# Altium schematic sheet ETHERNET_INTERFACE.SchDoc
size A4; SheetNumber: 5; SheetTotal: 20
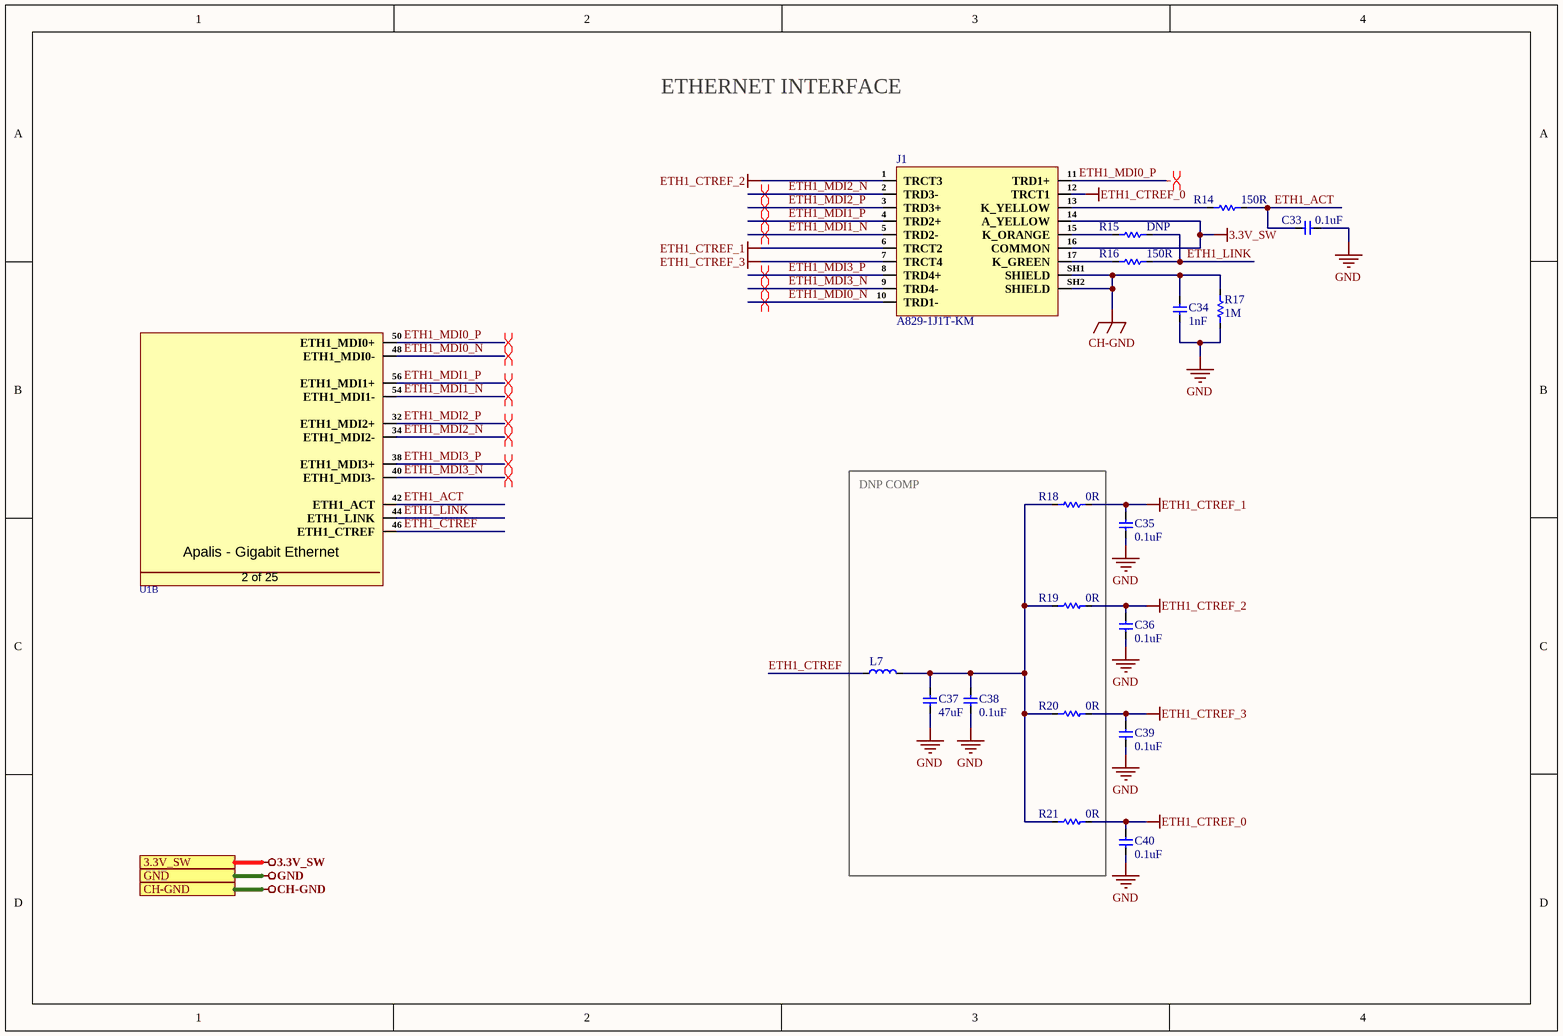
[diagram p0: ETHERNET_INTERFACE.SchDoc]

## Parts
C33  0.1uF  [Cap-0402]
C34  1nF  [Cap-1206]
C35  0.1uF  [Cap-0402]
C36  0.1uF  [Cap-0402]
C37  47uF  [Cap 2220]
C38  0.1uF  [Cap-0402]
C39  0.1uF  [Cap-0402]
C40  0.1uF  [Cap-0402]
J1  A829-1J1T-KM  [A829-1J1T-KM]
L7  BLM18EG221TN1D  [IND-0603 (1608 Metric)]  (value not drawn)
R14  150R  [Res-0402]
R15  DNP  [Res-0402]
R16  150R  [Res-0402]
R17  1M  [Res-0402]
R18  0R  [Res-0402]
R19  0R  [Res-0402]
R20  0R  [Res-0402]
R21  0R  [Res-0402]
U1  MM70-314B1-2-R300  [MM70-314B1-2-R300]  (value not drawn)  (part B of 25)

## Blocks framed on the sheet
DNP COMP: C37 C38 L7 R18-R21

## Ports
3.3V_SW (see Top_Sheet[1B], DIGITAL_I-O_O-P[1D], FUTURE_USE_CONNECTOR[1D], HDMI_INTERFACE[1D], I2C_INTERFACE[1B], MICRO_SD_CARD_INTERFACE[1D], UART_INTERFACE[1D]), CH-GND (see Top_Sheet[1B], HDMI_INTERFACE[1D], LTE_MODULE[1D], MECHANICAL_FOR_PCB[1D], USB3.0_INTERFACE[1D]), GND (see Top_Sheet[1B], 03-CAN2_SPI_CAN_CONTROLLER[1D], APALIS_POWER_SUPPLY[1D], CAN2_SPI_CAN_CONTROLLER[1D], CODEC_INTERFACE[1D], CONNECTORS[1D], DC_DC_CONVERTER[1D], DIGITAL_I-O_O-P[1D], FUTURE_USE_CONNECTOR[1D], GPIO_NC_INTERFACE[4B], HDMI_INTERFACE[1D], I2C_INTERFACE[1B], INPUT_SUPPLY_PROTECTION[1D], LTE_MODULE[1D], MECHANICAL_FOR_PCB[1D], MICRO_SD_CARD_INTERFACE[1D], Reset_and_SDIO[1D], UART_INTERFACE[1D], USB3.0_INTERFACE[1D])

## Nets
3.3V_SW: J1.14(A_YELLOW) J1.16(COMMON) ; port 3.3V_SW
CH-GND: C34.2 J1.SH1(SHIELD) J1.SH2(SHIELD) R17.2 ; port CH-GND
ETH1_CTREF_0: C40.2 J1.12(TRCT1) R21.2
ETH1_CTREF_1: C35.2 J1.6(TRCT2) R18.2
ETH1_CTREF_2: C36.2 J1.1(TRCT3) R19.2
ETH1_CTREF_3: C39.2 J1.7(TRCT4) R20.2
GND: C33.2 C34.1 C35.1 C36.1 C37.1 C38.1 C39.1 C40.1 R17.1 ; port GND
ETH1_ACT: C33.1 R14.2 U1.42(ETH1_ACT)
ETH1_CTREF: L7.1 U1.46(ETH1_CTREF)
ETH1_LINK: R15.2 R16.2 U1.44(ETH1_LINK)
ETH1_MDI0_N: J1.10(TRD1-) U1.48(ETH1_MDI0-)
ETH1_MDI0_P: J1.11(TRD1+) U1.50(ETH1_MDI0+)
ETH1_MDI1_N: J1.5(TRD2-) U1.54(ETH1_MDI1-)
ETH1_MDI1_P: J1.4(TRD2+) U1.56(ETH1_MDI1+)
ETH1_MDI2_N: J1.2(TRD3-) U1.34(ETH1_MDI2-)
ETH1_MDI2_P: J1.3(TRD3+) U1.32(ETH1_MDI2+)
ETH1_MDI3_N: J1.9(TRD4-) U1.40(ETH1_MDI3-)
ETH1_MDI3_P: J1.8(TRD4+) U1.38(ETH1_MDI3+)
NetC37_2: C37.2 C38.2 L7.2 R18.1 R19.1 R20.1 R21.1
NetJ1_13: J1.13(K_YELLOW) R14.1
NetJ1_15: J1.15(K_ORANGE) R15.1
NetJ1_17: J1.17(K_GREEN) R16.1

## Layout directives
differential pair; differential pair class DIFF-ETH-100; rule Impedance Constraint [Min = 98.00    Max = 103.0    ]; rule Matched Net Lengths [Tolerance = 0.508mm]: ETH1_MDI0_N, ETH1_MDI0_P, ETH1_MDI1_N, ETH1_MDI1_P, ETH1_MDI2_N, ETH1_MDI2_P, ETH1_MDI3_N, ETH1_MDI3_P

## Notes on the sheet
- ETHERNET INTERFACE
- (in symbol MM70-314B1-2-R300, part B) Apalis - Gigabit Ethernet; 2 of 25

## Library data of the parts
C33 C35 C36 C38-C40 = C0402C104K4REC7867: Cap Cer 0402 0.1UF 16V X7R 10%; Manufacturer: KEMET; Item Type: Capacitor; Supplier: Digi-Key; Supplier Part Number: 399-C0402C104K4REC7867CT-ND; Manufacturer Part Number: C0402C104K4REC7867; RoHS: No; Category: Ceramic Capacitors; Stock: 10918; Pricing: 1=0.1, 10=0.072, 50=0.0408, 100=0.0338, 500=0.02372, 1000=0.01963, 2500=0.01827, 5000=0.01672 (USD)
C34 = C1206C102KGRACAUTO: CAP CER 1000PF 2KV X7R 1206; Manufacturer: KEMET; Dielectric Material: Ceramic; Tolerance: 10%; Supplier: Mouser; Supplier Part Number: 80-C1206C102KGRAUTO; Manufacturer Part Number: C1206C102KGRACAUTO; RoHS: No; Category: Ceramic Capacitors; Stock: 90441; Pricing: 1=0.26, 10=0.119, 50=0.119, 100=0.072, 1000=0.063, 10000=0.052 (USD); Mounting Technology: Surface Mount; Case/Package: 1206; Case Code (Metric): 3216; Case Code (Imperial): 1206; Contact Plating: Tin,Matte; Min Operating Temperature: -55°C; Max Operating Temperature: 125°C; Voltage Rating: 2kV; Packaging: Cut Tape; Value: 1nF; Dielectric: X7R; Termination: SMD/SMT; Voltage Rating (DC): 2kV; Series: SMD Auto X7R HV; Construction: Flat; Length: 3.2mm; Ratings: AEC-Q200; Reach SVHC Compliant: No; RoHS Compliant: No; ComponentLink1URL: http://www.farnell.com/datasheets/2741171.pdf?src-supplier=Farnell; ComponentLink1Description: http://www.farnell.com/datasheets/2741171.pdf?src-supplier=Farnell; ComponentLink2URL: http://www.mouser.com/ds/2/212/KEM_C1010_X7R_HV_SMD-1102742.pdf?src-supplier=Mouser; ComponentLink2Description: http://www.mouser.com/ds/2/212/KEM_C1010_X7R_HV_SMD-1102742.pdf?src-supplier=Mouser; ComponentLink3URL: http://capacitoredge.kemet.com/capedge2/DataSheet/Datasheet-C1206C102KGRACAUTO.pdf?pn=C1206C102KGRACAUTO&src-supplier=Avnet; ComponentLink3Description: http://capacitoredge.kemet.com/capedge2/DataSheet/Datasheet-C1206C102KGRACAUTO.pdf?pn=C1206C102KGRACAUTO&src-supplier=Avnet; ComponentLink4URL: http://www.farnell.com/datasheets/2741171.pdf?src-supplier=Newark; ComponentLink4Description: http://www.farnell.com/datasheets/2741171.pdf?src-supplier=Newark; ComponentLink5URL: https://datasheet.octopart.com/C1206C102KGRACAUTO-Kemet-datasheet-41767101.pdf?src-supplier=Newark; ComponentLink5Description: https://datasheet.octopart.com/C1206C102KGRACAUTO-Kemet-datasheet-41767101.pdf?src-supplier=Newark; ComponentLink6URL: https://api.kemet.com/component-edge/download/datasheet/C1206C102KGRACAUTO.pdf?src-supplier=Digi-Key; ComponentLink6Description: https://api.kemet.com/component-edge/download/datasheet/C1206C102KGRACAUTO.pdf?src-supplier=Digi-Key; ComponentLink7URL: https://datasheet.octopart.com/C1206C102KGRACAUTO-KEMET-datasheet-149525142.pdf?src-supplier=Farnell; ComponentLink7Description: https://datasheet.octopart.com/C1206C102KGRACAUTO-KEMET-datasheet-149525142.pdf?src-supplier=Farnell; ComponentLink8URL: http://www.farnell.com/datasheets/2741171.pdf?src-supplier=Element14; ComponentLink8Description: http://www.farnell.com/datasheets/2741171.pdf?src-supplier=Element14; ComponentLink9URL: https://datasheet.octopart.com/C1206C102KGRACAUTO-Kemet-datasheet-66532414.pdf?src-supplier=Element14; ComponentLink9Description: https://datasheet.octopart.com/C1206C102KGRACAUTO-Kemet-datasheet-66532414.pdf?src-supplier=Element14; ComponentLink10URL: https://datasheet.octopart.com/C1206C102KGRACAUTO-KEMET-datasheet-140424778.pdf?src-supplier=TME; ComponentLink10Description: https://datasheet.octopart.com/C1206C102KGRACAUTO-KEMET-datasheet-140424778.pdf?src-supplier=TME; ComponentLink11URL: https://datasheet.octopart.com/C1206C102KGRACAUTO-KEMET-datasheet-147336163.pdf?src-supplier=LKR; ComponentLink11Description: https://datasheet.octopart.com/C1206C102KGRACAUTO-KEMET-datasheet-147336163.pdf?src-supplier=LKR
C37 = CGA9N3X7R1E476M230KB: CAP CER 47UF 25V X7R 2220; Manufacturer: TDK; Material: 4241ConductorMaterial; Tolerance: 20%; Supplier: Rs; Supplier Part Number: 2427522; Manufacturer Part Number: CGA9N3X7R1E476M230KB; RoHS: Yes; Category: Ceramic Capacitors; Stock: 467; Pricing: 1=3.07, 5=2.92, 10=2.76, 20=2.46, 100=2 (GBP); Mounting Technology: Surface Mount; Case/Package: 2220; Case Code (Imperial): 2220; Case Code (Metric): 5750; Min Operating Temperature: -55°C; Max Operating Temperature: 125°C; Packaging: Cut Tape; Value: 47uF; Voltage Rating: 25V; Series: CGA; Length: 5.7mm; Width: 5mm; Height: 2.8mm; Ratings: AEC-Q200; RoHS Compliant: Yes; ComponentLink1URL: https://product.tdk.com/info/en/catalog/spec/mlccspec_automotive_general_midvoltage_en.pdf?src-supplier=Digi-Key; ComponentLink1Description: https://product.tdk.com/info/en/catalog/spec/mlccspec_automotive_general_midvoltage_en.pdf?src-supplier=Digi-Key; ComponentLink2URL: https://product.tdk.com/info/en/catalog/datasheets/mlcc_automotive_general_en.pdf?src-supplier=Digi-Key; ComponentLink2Description: https://product.tdk.com/info/en/catalog/datasheets/mlcc_automotive_general_en.pdf?src-supplier=Digi-Key; ComponentLink3URL: https://product.tdk.com/info/en/catalog/datasheets/mlcc_automotive_general_en.pdf?ref_disty=digikey&src-supplier=Digi-Key; ComponentLink3Description: https://product.tdk.com/info/en/catalog/datasheets/mlcc_automotive_general_en.pdf?ref_disty=digikey&src-supplier=Digi-Key; ComponentLink4URL: https://datasheet.octopart.com/CGA9N3X7R1E476M230KB-TDK-datasheet-43366117.pdf?src-supplier=Future+Electronics; ComponentLink4Description: https://datasheet.octopart.com/CGA9N3X7R1E476M230KB-TDK-datasheet-43366117.pdf?src-supplier=Future+Electronics
J1 = A829-1J1T-KM: CONN JACK 1PORT 1000 BASE-TX PCB; Manufacturer: Bel; Supplier: Mouser; Supplier Part Number: 530-A829-1J1T-KM; Manufacturer Part Number: A829-1J1T-KM; RoHS: Yes; Category: Modular / Ethernet Connectors; Stock: 1152; Pricing: 1=7.48, 10=6.77, 50=6.4, 100=6.4, 1000=4.99, 10000=4.99 (USD); ComponentLink1URL: https://belfuse.com/resources/drawings/magneticsolutions/dr-mag-a829-1j1t-km.pdf?src-supplier=Digi-Key; ComponentLink1Description: https://belfuse.com/resources/drawings/magneticsolutions/dr-mag-a829-1j1t-km.pdf?src-supplier=Digi-Key; ComponentLink2URL: https://datasheet.octopart.com/A829-1J1T-KM-Bel-Fuse-datasheet-154547170.pdf?src-supplier=Electro+Sonic; ComponentLink2Description: https://datasheet.octopart.com/A829-1J1T-KM-Bel-Fuse-datasheet-154547170.pdf?src-supplier=Electro+Sonic
L7 = BLM18EG221TN1D: FERRITE BEAD 220 OHM 0603 1LN; Manufacturer: Murata; Supplier: Avnet; Supplier Part Number: BLM18EG221TN1D; Manufacturer Part Number: BLM18EG221TN1D; RoHS: Yes; Category: Ferrite Beads and Chips; Stock: 4000; Pricing: 4000=0.07735, 8000=0.07553, 16000=0.07371, 24000=0.07189, 32000=0.07007 (USD); ComponentLink1URL: https://datasheet.ciiva.com/11795/0900766b811b5866-11795384.pdf?src-supplier=Rs; ComponentLink1Description: https://datasheet.ciiva.com/11795/0900766b811b5866-11795384.pdf?src-supplier=Rs; ComponentLink2URL: https://datasheet.ciiva.com/41449/001172266-da-01-en-drossel-0603-220r-1-6x0-8mm-4000st-41449580.pdf?src-supplier=Conrad; ComponentLink2Description: https://datasheet.ciiva.com/41449/001172266-da-01-en-drossel-0603-220r-1-6x0-8mm-4000st-41449580.pdf?src-supplier=Conrad; ComponentLink3URL: https://datasheet.ciiva.com/1467/5169-1467159.pdf?src-supplier=Element14; ComponentLink3Description: https://datasheet.ciiva.com/1467/5169-1467159.pdf?src-supplier=Element14; ComponentLink4URL: https://datasheet.ciiva.com/1467/5169-1467160.pdf?src-supplier=Element14; ComponentLink4Description: https://datasheet.ciiva.com/1467/5169-1467160.pdf?src-supplier=Element14; ComponentLink5URL: https://datasheet.ciiva.com/8510/l0110s0101blm18e-8510167.pdf?src-supplier=Avnet; ComponentLink5Description: https://datasheet.ciiva.com/8510/l0110s0101blm18e-8510167.pdf?src-supplier=Avnet; ComponentLink6URL: https://datasheet.ciiva.com/16419/l0110s0101blm18e-16419150.pdf?src-supplier=Future+Electronics; ComponentLink6Description: https://datasheet.ciiva.com/16419/l0110s0101blm18e-16419150.pdf?src-supplier=Future+Electronics; ComponentLink7URL: https://datasheet.ciiva.com/6211/l0110s0101blm18e-6211853.pdf?src-supplier=Digi-Key; ComponentLink7Description: https://datasheet.ciiva.com/6211/l0110s0101blm18e-6211853.pdf?src-supplier=Digi-Key
R14-R16 = CRGCQ0402F150R: RES 150 OHM 1% 1/16W 0402; Manufacturer: TE Connectivity; Supplier: Arrow Electronics; Supplier Part Number: CRGCQ0402F150R; Manufacturer Part Number: CRGCQ0402F150R; RoHS: Yes; Category: Chip SMD Resistors; Stock: 712; Pricing: 1=0.0975, 10=0.0101, 25=0.01, 100=0.0051, 250=0.005, 500=0.0042 (USD); ComponentLink1URL: http://datasheet.octopart.com/CRGCQ0402F150R-TE-Connectivity-datasheet-114679081.pdf?src-supplier=Verical; ComponentLink1Description: http://datasheet.octopart.com/CRGCQ0402F150R-TE-Connectivity-datasheet-114679081.pdf?src-supplier=Verical; ComponentLink2URL: http://datasheet.octopart.com/CRGCQ0402F150R-TE-Connectivity-datasheet-114679081.pdf?src-supplier=Avnet; ComponentLink2Description: http://datasheet.octopart.com/CRGCQ0402F150R-TE-Connectivity-datasheet-114679081.pdf?src-supplier=Avnet; ComponentLink3URL: http://datasheet.octopart.com/CRGCQ0402F150R-TE-Connectivity-datasheet-114679081.pdf?src-supplier=Newark; ComponentLink3Description: http://datasheet.octopart.com/CRGCQ0402F150R-TE-Connectivity-datasheet-114679081.pdf?src-supplier=Newark; ComponentLink4URL: https://4donline.ihs.com/images/VipMasterIC/IC/TYEL/TYEL-S-A0004929575/TYEL-S-A0004929575-1.pdf?hkey=52A5661711E402568146F3353EA87419&src-supplier=Newark; ComponentLink4Description: https://4donline.ihs.com/images/VipMasterIC/IC/TYEL/TYEL-S-A0004929575/TYEL-S-A0004929575-1.pdf?hkey=52A5661711E402568146F3353EA87419&src-supplier=Newark; ComponentLink5URL: http://datasheet.octopart.com/CRGCQ0402F150R-TE-Connectivity-datasheet-114679081.pdf?src-supplier=Onlinecomponents.com; ComponentLink5Description: http://datasheet.octopart.com/CRGCQ0402F150R-TE-Connectivity-datasheet-114679081.pdf?src-supplier=Onlinecomponents.com; ComponentLink6URL: https://4donline.ihs.com/images/VipMasterIC/IC/TYEL/TYEL-S-A0004929575/TYEL-S-A0004929575-1.pdf?hkey=52A5661711E402568146F3353EA87419&src-supplier=Farnell; ComponentLink6Description: https://4donline.ihs.com/images/VipMasterIC/IC/TYEL/TYEL-S-A0004929575/TYEL-S-A0004929575-1.pdf?hkey=52A5661711E402568146F3353EA87419&src-supplier=Farnell; ComponentLink7URL: http://datasheet.octopart.com/CRGCQ0402F150R-TE-Connectivity-datasheet-114679081.pdf?src-supplier=Mouser; ComponentLink7Description: http://datasheet.octopart.com/CRGCQ0402F150R-TE-Connectivity-datasheet-114679081.pdf?src-supplier=Mouser; ComponentLink8URL: https://www.te.com/commerce/DocumentDelivery/DDEController?Action=srchrtrv&DocNm=1773204-3&DocType=DS&DocLang=English&src-supplier=Digi-Key; ComponentLink8Description: https://www.te.com/commerce/DocumentDelivery/DDEController?Action=srchrtrv&DocNm=1773204-3&DocType=DS&DocLang=English&src-supplier=Digi-Key; ComponentLink9URL: http://datasheet.octopart.com/CRGCQ0402F150R-TE-Connectivity-datasheet-114679081.pdf?src-supplier=Digi-Key; ComponentLink9Description: http://datasheet.octopart.com/CRGCQ0402F150R-TE-Connectivity-datasheet-114679081.pdf?src-supplier=Digi-Key; ComponentLink10URL: http://datasheet.octopart.com/CRGCQ0402F150R-TE-Connectivity-datasheet-114679081.pdf?src-supplier=Heilind+Electronics; ComponentLink10Description: http://datasheet.octopart.com/CRGCQ0402F150R-TE-Connectivity-datasheet-114679081.pdf?src-supplier=Heilind+Electronics; ComponentLink11URL: http://datasheet.octopart.com/CRGCQ0402F150R-TE-Connectivity-datasheet-114679081.pdf?src-supplier=Electro+Sonic; ComponentLink11Description: http://datasheet.octopart.com/CRGCQ0402F150R-TE-Connectivity-datasheet-114679081.pdf?src-supplier=Electro+Sonic; ComponentLink12URL: http://datasheet.octopart.com/CRGCQ0402F150R-TE-Connectivity-datasheet-114679081.pdf?src-supplier=Interstate+Connecting+Components; ComponentLink12Description: http://datasheet.octopart.com/CRGCQ0402F150R-TE-Connectivity-datasheet-114679081.pdf?src-supplier=Interstate+Connecting+Components; ComponentLink13URL: http://datasheet.octopart.com/CRGCQ0402F150R-TE-Connectivity-datasheet-114679081.pdf?src-supplier=TME; ComponentLink13Description: http://datasheet.octopart.com/CRGCQ0402F150R-TE-Connectivity-datasheet-114679081.pdf?src-supplier=TME; ComponentLink14URL: http://datasheet.octopart.com/CRGCQ0402F150R-TE-Connectivity-datasheet-114679081.pdf?src-supplier=Sager+Electronics; ComponentLink14Description: http://datasheet.octopart.com/CRGCQ0402F150R-TE-Connectivity-datasheet-114679081.pdf?src-supplier=Sager+Electronics; ComponentLink15URL: https://datasheet.octopart.com/CRGCQ0402F150R-TE-Connectivity-datasheet-114679081.pdf?src-supplier=Master+Electronics; ComponentLink15Description: https://datasheet.octopart.com/CRGCQ0402F150R-TE-Connectivity-datasheet-114679081.pdf?src-supplier=Master+Electronics
R17 = CRGCQ0402J1M0: RES 1M OHM 5% 1/16W 0402; Manufacturer: TE Connectivity; Value: 1MR; Max Power Dissipation: 63mW; Temperature Coefficient: 100ppm/°C; Power Rating: 62.5mW; Voltage Rating: 50V; Supplier: Arrow Electronics; Supplier Part Number: CRGCQ0402J1M0; Manufacturer Part Number: CRGCQ0402J1M0; RoHS: Yes; Category: Chip SMD Resistors; Stock: 50000; Pricing: 20000=0.0015 (USD); Case/Package: 0402; Case Code (Imperial): 0402; Case Code (Metric): 1005; Min Operating Temperature: -55°C; Max Operating Temperature: 155°C; Features: Moisture Resistant,Automotive AEC-Q200; Packaging: Cut Tape; Tolerance: 5%; Number of Terminations: 2; Series: CRGCQ; Voltage Rating (DC): 50V; Height: 400um; Ratings: AEC-Q200; RoHS Compliant: Yes; ComponentLink1URL: http://datasheet.octopart.com/CRGCQ0402J1M0-TE-Connectivity-datasheet-114679081.pdf?src-supplier=Mouser; ComponentLink1Description: http://datasheet.octopart.com/CRGCQ0402J1M0-TE-Connectivity-datasheet-114679081.pdf?src-supplier=Mouser; ComponentLink2URL: http://datasheet.octopart.com/CRGCQ0402J1M0-TE-Connectivity-datasheet-114679081.pdf?src-supplier=Arrow+Electronics; ComponentLink2Description: http://datasheet.octopart.com/CRGCQ0402J1M0-TE-Connectivity-datasheet-114679081.pdf?src-supplier=Arrow+Electronics; ComponentLink3URL: http://datasheet.octopart.com/CRGCQ0402J1M0-TE-Connectivity-datasheet-114679081.pdf?src-supplier=Onlinecomponents.com; ComponentLink3Description: http://datasheet.octopart.com/CRGCQ0402J1M0-TE-Connectivity-datasheet-114679081.pdf?src-supplier=Onlinecomponents.com; ComponentLink4URL: http://datasheet.octopart.com/CRGCQ0402J1M0-TE-Connectivity-datasheet-114679081.pdf?src-supplier=Digi-Key; ComponentLink4Description: http://datasheet.octopart.com/CRGCQ0402J1M0-TE-Connectivity-datasheet-114679081.pdf?src-supplier=Digi-Key; ComponentLink5URL: http://datasheet.octopart.com/CRGCQ0402J1M0-TE-Connectivity-datasheet-114679081.pdf?src-supplier=Verical; ComponentLink5Description: http://datasheet.octopart.com/CRGCQ0402J1M0-TE-Connectivity-datasheet-114679081.pdf?src-supplier=Verical; ComponentLink6URL: https://www.te.com/commerce/DocumentDelivery/DDEController?Action=srchrtrv&DocNm=1773204-3&DocType=DS&DocLang=English&src-supplier=Digi-Key; ComponentLink6Description: https://www.te.com/commerce/DocumentDelivery/DDEController?Action=srchrtrv&DocNm=1773204-3&DocType=DS&DocLang=English&src-supplier=Digi-Key; ComponentLink7URL: http://datasheet.octopart.com/CRGCQ0402J1M0-TE-Connectivity-datasheet-114679081.pdf?src-supplier=Newark; ComponentLink7Description: http://datasheet.octopart.com/CRGCQ0402J1M0-TE-Connectivity-datasheet-114679081.pdf?src-supplier=Newark; ComponentLink8URL: http://datasheet.octopart.com/CRGCQ0402J1M0-TE-Connectivity-datasheet-114679081.pdf?src-supplier=Avnet; ComponentLink8Description: http://datasheet.octopart.com/CRGCQ0402J1M0-TE-Connectivity-datasheet-114679081.pdf?src-supplier=Avnet; ComponentLink9URL: http://datasheet.octopart.com/CRGCQ0402J1M0-TE-Connectivity-datasheet-114679081.pdf?src-supplier=Farnell; ComponentLink9Description: http://datasheet.octopart.com/CRGCQ0402J1M0-TE-Connectivity-datasheet-114679081.pdf?src-supplier=Farnell; ComponentLink10URL: http://datasheet.octopart.com/CRGCQ0402J1M0-TE-Connectivity-datasheet-114679081.pdf?src-supplier=Sager+Electronics; ComponentLink10Description: http://datasheet.octopart.com/CRGCQ0402J1M0-TE-Connectivity-datasheet-114679081.pdf?src-supplier=Sager+Electronics; ComponentLink11URL: http://datasheet.octopart.com/CRGCQ0402J1M0-TE-Connectivity-datasheet-114679081.pdf?src-supplier=TME; ComponentLink11Description: http://datasheet.octopart.com/CRGCQ0402J1M0-TE-Connectivity-datasheet-114679081.pdf?src-supplier=TME; ComponentLink12URL: http://datasheet.octopart.com/CRGCQ0402J1M0-TE-Connectivity-datasheet-114679081.pdf?src-supplier=Electro+Sonic; ComponentLink12Description: http://datasheet.octopart.com/CRGCQ0402J1M0-TE-Connectivity-datasheet-114679081.pdf?src-supplier=Electro+Sonic; ComponentLink13URL: http://datasheet.octopart.com/CRGCQ0402J1M0-TE-Connectivity-datasheet-114679081.pdf?src-supplier=Interstate+Connecting+Components; ComponentLink13Description: http://datasheet.octopart.com/CRGCQ0402J1M0-TE-Connectivity-datasheet-114679081.pdf?src-supplier=Interstate+Connecting+Components; ComponentLink14URL: http://datasheet.octopart.com/CRGCQ0402J1M0-TE-Connectivity-datasheet-114679081.pdf?src-supplier=Heilind+Electronics; ComponentLink14Description: http://datasheet.octopart.com/CRGCQ0402J1M0-TE-Connectivity-datasheet-114679081.pdf?src-supplier=Heilind+Electronics; ComponentLink15URL: https://datasheet.octopart.com/CRGCQ0402J1M0-TE-Connectivity-datasheet-114679081.pdf?src-supplier=Master+Electronics; ComponentLink15Description: https://datasheet.octopart.com/CRGCQ0402J1M0-TE-Connectivity-datasheet-114679081.pdf?src-supplier=Master+Electronics
R18-R21 = ERJ-2GE0R00X: RES SMD 0 OHM JUMPER 1/10W 0402; Manufacturer: Panasonic; Value: 0mR; Power Rating: 100mW; Voltage Rating: 50V; Tolerance: 5%; Temperature Coefficient: 600ppm/°C; Supplier: Mouser; Supplier Part Number: 667-ERJ-2GE0R00X; Manufacturer Part Number: ERJ-2GE0R00X; RoHS: Yes; Category: Chip SMD Resistors; Stock: 10959876; Pricing: 1=0.1, 10=0.013, 50=0.013, 100=0.006, 1000=0.004, 10000=0.003 (USD); Mounting Technology: Surface Mount; Case/Package: 0402; Pins: 2NUMBER; Contact Plating: Tin; Case Code (Metric): 1005; Case Code (Imperial): 0402; Min Operating Temperature: -55°C; Max Operating Temperature: 155°C; Resistor Type: Thick Film; Packaging: Cut Tape; Package Quantity: 10000; Number of Terminations: 2; Termination: SMD/SMT; Max Power Dissipation: 100mW; Voltage Rating (DC): 50V; Features: Automotive AEC-Q200; Series: ERJ; Construction: Rectangular; Technology: THICK FILM; Length: 1mm; Width: 0.5mm; Height: 0.35mm; Depth: 0.5mm; Ratings: AEC-Q200; Radiation Hardening: No; Reach SVHC Compliant: No; Military Standard: Not; Lead Free: Lead Free; RoHS Compliant: Yes; ComponentLink1URL: https://datasheet.ciiva.com/11821/0900766b80f806dd-11821176.pdf?src-supplier=Rs; ComponentLink1Description: https://datasheet.ciiva.com/11821/0900766b80f806dd-11821176.pdf?src-supplier=Rs; ComponentLink2URL: https://datasheet.ciiva.com/46389/1678796-46389518.pdf?src-supplier=Element14; ComponentLink2Description: https://datasheet.ciiva.com/46389/1678796-46389518.pdf?src-supplier=Element14; ComponentLink3URL: https://datasheet.ciiva.com/28695/1678796-28695758.pdf?src-supplier=Element14; ComponentLink3Description: https://datasheet.ciiva.com/28695/1678796-28695758.pdf?src-supplier=Element14; ComponentLink4URL: https://datasheet.ciiva.com/16778/70260739-16778335.pdf?src-supplier=Allied+Electronics; ComponentLink4Description: https://datasheet.ciiva.com/16778/70260739-16778335.pdf?src-supplier=Allied+Electronics; ComponentLink5URL: https://datasheet.ciiva.com/48531/aoa0000ce1-48531077.pdf?src-supplier=Avnet; ComponentLink5Description: https://datasheet.ciiva.com/48531/aoa0000ce1-48531077.pdf?src-supplier=Avnet; ComponentLink6URL: https://datasheet.ciiva.com/30097/4aoa0000ce1-30097116.pdf?src-supplier=Onlinecomponents.com; ComponentLink6Description: https://datasheet.ciiva.com/30097/4aoa0000ce1-30097116.pdf?src-supplier=Onlinecomponents.com; ComponentLink7URL: https://datasheet.ciiva.com/43460/1678796-43460347.pdf?src-supplier=Farnell; ComponentLink7Description: https://datasheet.ciiva.com/43460/1678796-43460347.pdf?src-supplier=Farnell; ComponentLink8URL: https://datasheet.ciiva.com/5959/1678796-5959692.pdf?src-supplier=Farnell; ComponentLink8Description: https://datasheet.ciiva.com/5959/1678796-5959692.pdf?src-supplier=Farnell; ComponentLink9URL: https://datasheet.ciiva.com/16783/70260739-16783734.pdf?src-supplier=Allied+Electronics; ComponentLink9Description: https://datasheet.ciiva.com/16783/70260739-16783734.pdf?src-supplier=Allied+Electronics
U1 = MM70-314B1-2-R300: CONN MXM 3.0 FMALE 314POS 0.020; Manufacturer: JAE Electronics; Supplier: Digi-Key; Supplier Part Number: 670-MM70-314B1-2-R300CT-ND; Manufacturer Part Number: MM70-314B1-2-R300; RoHS: No; Category: Card Edge Connectors; Stock: 4979; Pricing: 1=9.21, 10=8.287, 25=7.8064, 50=7.6064, 100=7.4062 (USD)